# Altium schematic sheet Slide Switch with an MCU.SchDoc
size A; SheetNumber: 3; SheetTotal: 6
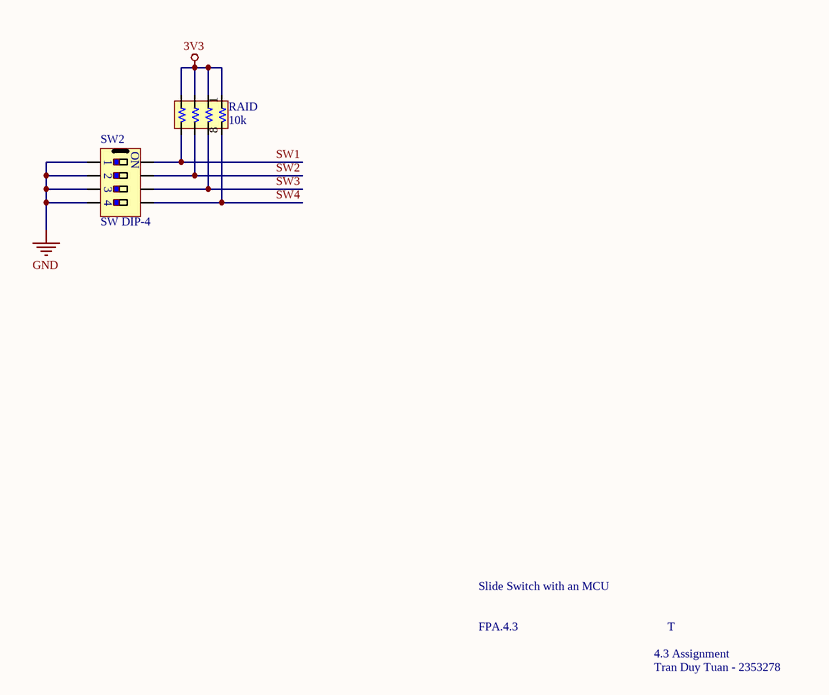
[diagram p0: Slide Switch with an MCU.SchDoc]

## Parts
RAID  10k  [RA4 1206 (3216)]
SW2  SW DIP-4  [SW/DIP4]

## Nets
3V3: RAID.1 RAID.2 RAID.3 RAID.4
GND: SW2.1 SW2.2 SW2.3 SW2.4
SW1: RAID.5 SW2.8
SW2: RAID.6 SW2.7
SW3: RAID.7 SW2.6
SW4: RAID.8 SW2.5

## Notes on the sheet
- Slide Switch with an MCU
- FPA.4.3
- 4.3 Assignment
- T
- Tran Duy Tuan - 2353278
- (in symbol SW DIP-4) ON

## Library data of the parts
RAID = Resistor Array 4